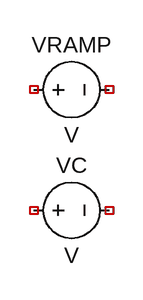
[diagram p0: schematic Draft1.asc]
Draft1.asc, the LTspice schematic file:
Version 4.1
SHEET 1 880 680
SYMBOL voltage 240 80 R270
WINDOW 0 32 56 VTop 2
WINDOW 3 -32 56 VBottom 2
SYMATTR InstName VRAMP
SYMBOL voltage 240 208 R270
WINDOW 0 32 56 VTop 2
WINDOW 3 -32 56 VBottom 2
SYMATTR InstName VC

The netlist it stands for:
* Draft1.asc
VRAMP NC_01 NC_02 V
VC NC_03 NC_04 V
.backanno
.end